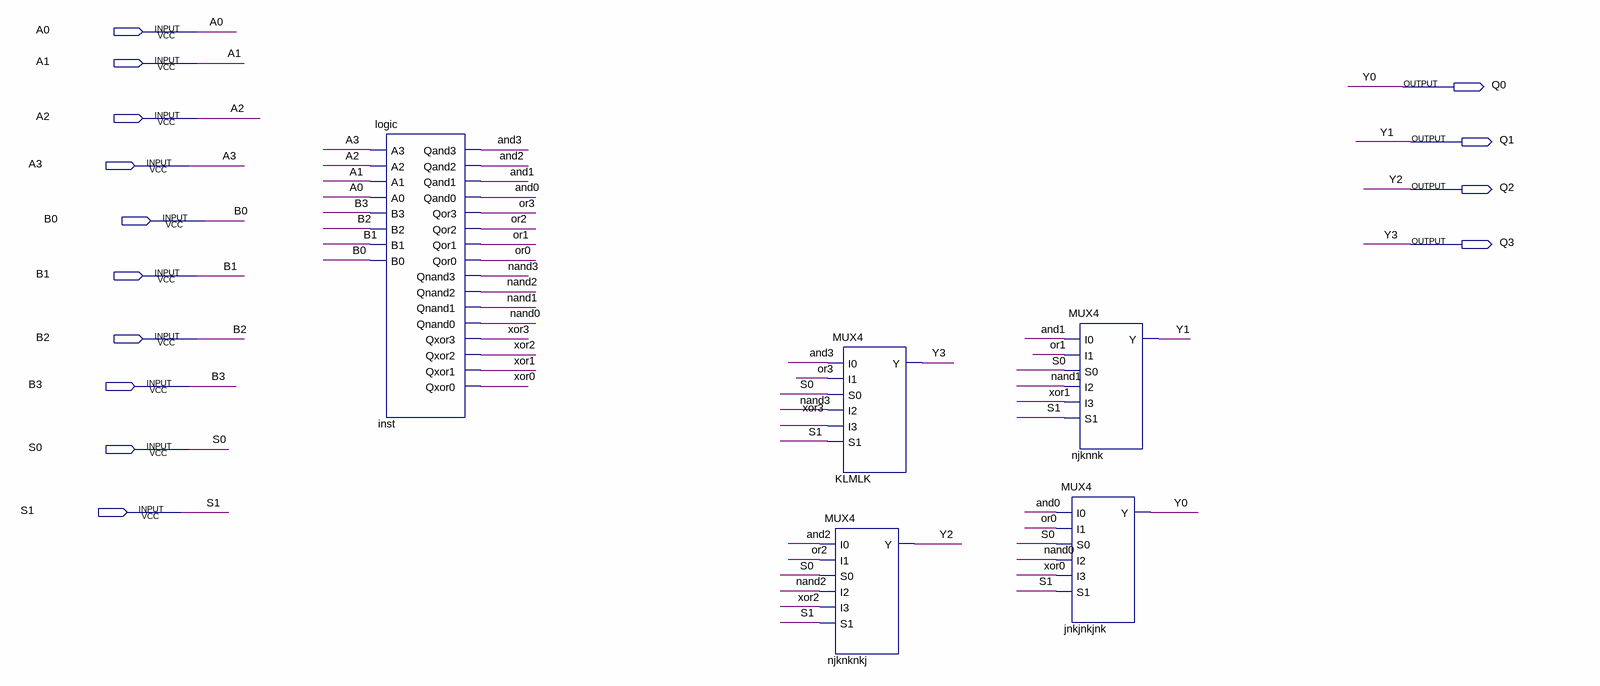
[diagram p0: schematic sheet]
// Quartus schematic logicse.bdf as structural Verilog: 5 symbols, 14 pins
module logicse (
  input  A0,
  input  A1,
  input  A2,
  input  A3,
  input  B0,
  input  B1,
  input  B2,
  input  B3,
  input  S0,
  input  S1,
  output Q0,
  output Q1,
  output Q2,
  output Q3
);

  wire and0, and1, and2, and3, nand0, nand1, nand2, nand3, or0, or1, or2, or3, xor0, xor1, xor2, xor3;

  \logic  inst (
    .A3(A3), .A2(A2), .A1(A1), .A0(A0), .B3(B3), .B2(B2), .B1(B1), .B0(B0), .Qand3(and3), .Qand2(and2),
    .Qand1(and1), .Qand0(and0), .Qor3(or3), .Qor2(or2), .Qor1(or1), .Qor0(or0), .Qnand3(nand3),
    .Qnand2(nand2), .Qnand1(nand1), .Qnand0(nand0), .Qxor3(xor3), .Qxor2(xor2), .Qxor1(xor1), .Qxor0(xor0));
  MUX4 KLMLK (.I0(and3), .I1(or3), .S0(S0), .I2(nand3), .I3(xor3), .S1(S1), .Y(Q3));
  MUX4 njknknkj (.I0(and2), .I1(or2), .S0(S0), .I2(nand2), .I3(xor2), .S1(S1), .Y(Q2));
  MUX4 njknnk (.I0(and1), .I1(or1), .S0(S0), .I2(nand1), .I3(xor1), .S1(S1), .Y(Q1));
  MUX4 jnkjnkjnk (.I0(and0), .I1(or0), .S0(S0), .I2(nand0), .I3(xor0), .S1(S1), .Y(Q0));

  // Other names for the same wires on the sheet: Y0 = Q0; Y1 = Q1; Y2 = Q2; Y3 = Q3
endmodule
